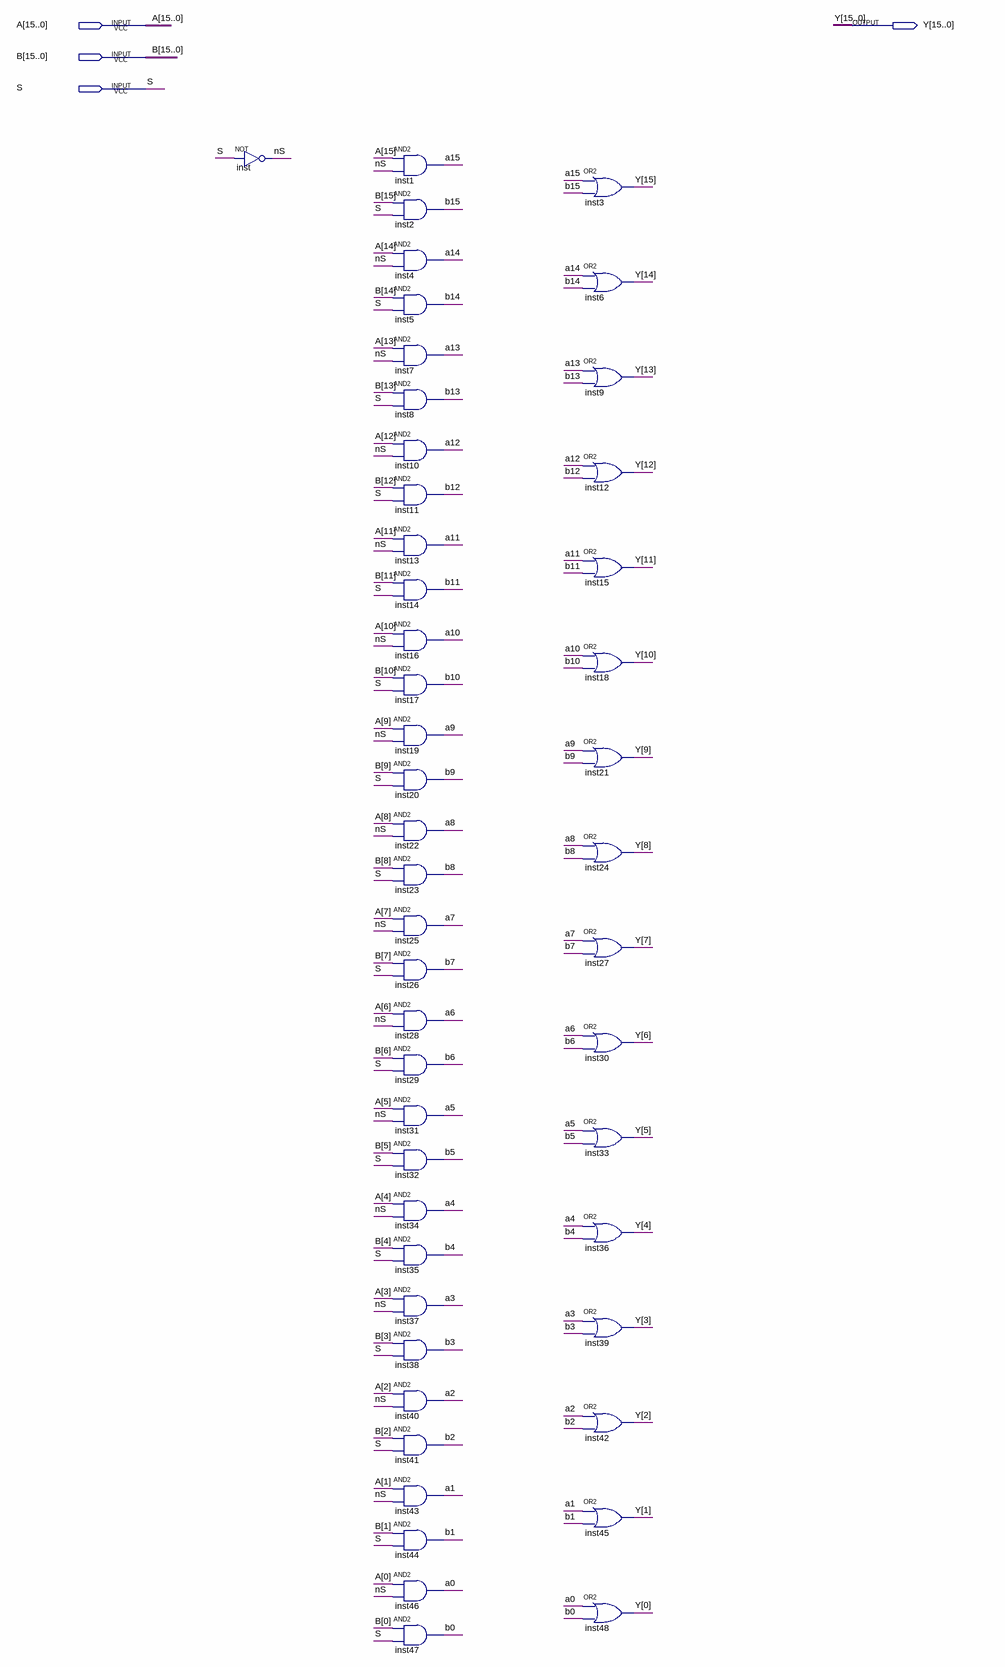
[diagram p0: schematic sheet]
// Quartus schematic mux2_1_16bit.bdf as structural Verilog: 49 symbols, 4 pins
module mux2_1_16bit (
  input  [15:0] A,
  input  [15:0] B,
  input  S,
  output [15:0] Y
);

  wire nS;

  not inst (nS, S);
  and inst1 (A[15], A[15], nS);
  and inst2 (B[15], B[15], S);
  and inst4 (A[14], A[14], nS);
  and inst5 (B[14], B[14], S);
  and inst7 (A[13], A[13], nS);
  and inst8 (B[13], B[13], S);
  and inst10 (A[12], A[12], nS);
  and inst11 (B[12], B[12], S);
  and inst13 (A[11], A[11], nS);
  and inst14 (B[11], B[11], S);
  and inst16 (A[10], A[10], nS);
  and inst17 (B[10], B[10], S);
  and inst19 (A[9], A[9], nS);
  and inst20 (B[9], B[9], S);
  and inst22 (A[8], A[8], nS);
  and inst23 (B[8], B[8], S);
  and inst25 (A[7], A[7], nS);
  and inst26 (B[7], B[7], S);
  and inst28 (A[6], A[6], nS);
  and inst29 (B[6], B[6], S);
  and inst31 (A[5], A[5], nS);
  and inst32 (B[5], B[5], S);
  and inst34 (A[4], A[4], nS);
  and inst35 (B[4], B[4], S);
  and inst37 (A[3], A[3], nS);
  and inst38 (B[3], B[3], S);
  and inst40 (A[2], A[2], nS);
  and inst41 (B[2], B[2], S);
  and inst43 (A[1], A[1], nS);
  and inst44 (B[1], B[1], S);
  and inst46 (A[0], A[0], nS);
  and inst47 (B[0], B[0], S);
  or inst3 (Y[15], A[15], B[15]);
  or inst6 (Y[14], A[14], B[14]);
  or inst9 (Y[13], A[13], B[13]);
  or inst12 (Y[12], A[12], B[12]);
  or inst15 (Y[11], A[11], B[11]);
  or inst18 (Y[10], A[10], B[10]);
  or inst21 (Y[9], A[9], B[9]);
  or inst24 (Y[8], A[8], B[8]);
  or inst27 (Y[7], A[7], B[7]);
  or inst30 (Y[6], A[6], B[6]);
  or inst33 (Y[5], A[5], B[5]);
  or inst36 (Y[4], A[4], B[4]);
  or inst39 (Y[3], A[3], B[3]);
  or inst42 (Y[2], A[2], B[2]);
  or inst45 (Y[1], A[1], B[1]);
  or inst48 (Y[0], A[0], B[0]);
endmodule
